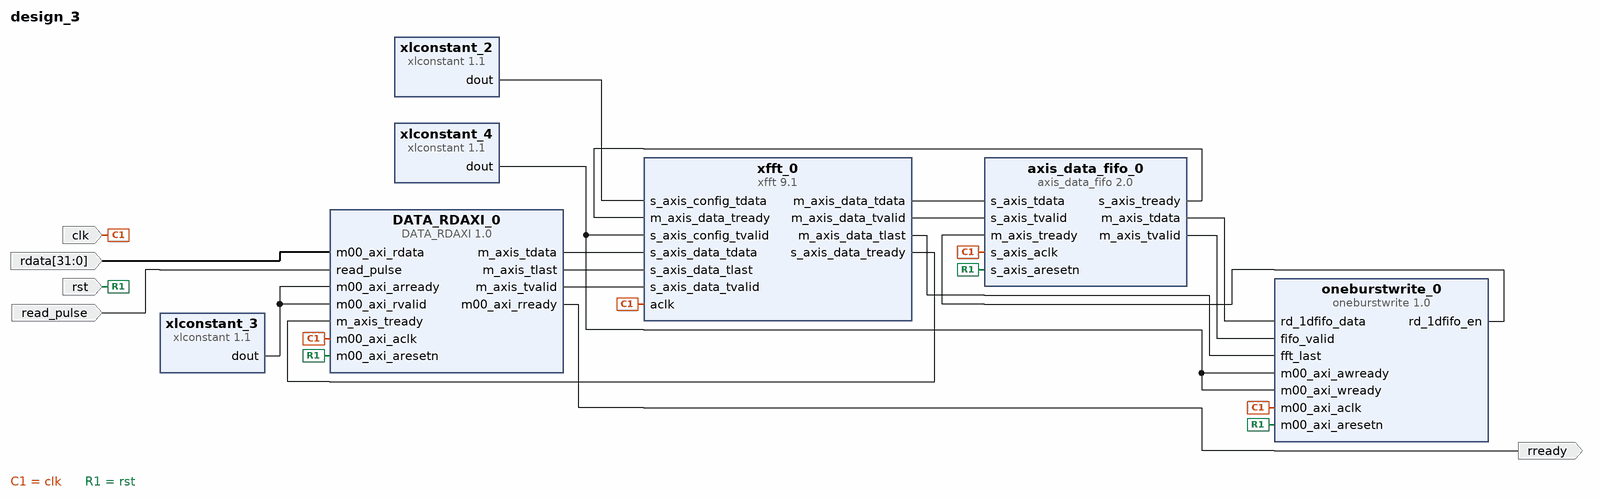
[diagram p0: block diagram of the top level]
# Vivado block design design_3, xczu4ev-sfvc784-1-i, Vivado 2022.1
create_bd_design design_3

create_bd_port -dir I read_pulse
create_bd_port -dir O rready
create_bd_port -dir I -from 31 -to 0 rdata
create_bd_port -dir I -type rst rst
create_bd_port -dir I -type clk clk
set_property -dict {CONFIG.FREQ_HZ 250000000} [get_bd_ports clk]

create_bd_cell -type ip -vlnv xilinx.com:ip:xfft:9.1 xfft_0
set_property -dict [list \
  CONFIG.complex_mult_type use_mults_performance \
  CONFIG.implementation_options radix_4_burst_io \
  CONFIG.memory_options_data block_ram \
  CONFIG.memory_options_hybrid false \
  CONFIG.memory_options_phase_factors block_ram \
  CONFIG.memory_options_reorder block_ram \
  CONFIG.number_of_stages_using_block_ram_for_data_and_phase_factors 0 \
  CONFIG.output_ordering natural_order \
  CONFIG.phase_factor_width 16 \
  CONFIG.rounding_modes convergent_rounding \
  CONFIG.scaling_options unscaled \
  CONFIG.target_clock_frequency 250 \
  CONFIG.throttle_scheme nonrealtime \
  CONFIG.xk_index true \
] [get_bd_cells xfft_0]
create_bd_cell -type ip -vlnv xilinx.com:ip:axis_data_fifo:2.0 axis_data_fifo_0
set_property -dict [list \
  CONFIG.FIFO_DEPTH 32768 \
  CONFIG.FIFO_MEMORY_TYPE block \
  CONFIG.HAS_RD_DATA_COUNT 1 \
  CONFIG.HAS_WR_DATA_COUNT 1 \
  CONFIG.IS_ACLK_ASYNC 0 \
  CONFIG.TDATA_NUM_BYTES 8 \
] [get_bd_cells axis_data_fifo_0]
create_bd_cell -type ip -vlnv xilinx.com:ip:xlconstant:1.1 xlconstant_3
create_bd_cell -type ip -vlnv xilinx.com:ip:xlconstant:1.1 xlconstant_4
create_bd_cell -type ip -vlnv xilinx.com:ip:xlconstant:1.1 xlconstant_2
set_property -dict {CONFIG.CONST_WIDTH 8} [get_bd_cells xlconstant_2]
create_bd_cell -type ip -vlnv xilinx.com:user:DATA_RDAXI:1.0 DATA_RDAXI_0
set_property -dict {CONFIG.C_M00_AXI_BURST_LEN 256} [get_bd_cells DATA_RDAXI_0]
create_bd_cell -type ip -vlnv xilinx.com:user:oneburstwrite:1.0 oneburstwrite_0
set_property -dict [list \
  CONFIG.C_M00_AXI_BURST_LEN 1 \
  CONFIG.C_M00_AXI_DATA_WIDTH 64 \
  CONFIG.C_M00_AXI_TARGET_SLAVE_BASE_ADDR 0x02000000 \
] [get_bd_cells oneburstwrite_0]

# ---- connections ----

connect_bd_net [get_bd_pins DATA_RDAXI_0/m00_axi_rready] [get_bd_ports rready]
connect_bd_net [get_bd_pins DATA_RDAXI_0/m_axis_tdata] [get_bd_pins xfft_0/s_axis_data_tdata]
connect_bd_net [get_bd_pins DATA_RDAXI_0/m_axis_tlast] [get_bd_pins xfft_0/s_axis_data_tlast]
connect_bd_net [get_bd_pins DATA_RDAXI_0/m_axis_tvalid] [get_bd_pins xfft_0/s_axis_data_tvalid]
connect_bd_net [get_bd_pins axis_data_fifo_0/m_axis_tdata] [get_bd_pins oneburstwrite_0/rd_1dfifo_data]
connect_bd_net [get_bd_pins axis_data_fifo_0/m_axis_tvalid] [get_bd_pins oneburstwrite_0/fifo_valid]
connect_bd_net [get_bd_pins axis_data_fifo_0/s_axis_tready] [get_bd_pins xfft_0/m_axis_data_tready]
connect_bd_net -net m00_axi_aclk_0_1 [get_bd_ports clk] \
  [get_bd_pins xfft_0/aclk] [get_bd_pins axis_data_fifo_0/s_axis_aclk] [get_bd_pins DATA_RDAXI_0/m00_axi_aclk] \
  [get_bd_pins oneburstwrite_0/m00_axi_aclk]
connect_bd_net -net m00_axi_aresetn_0_1 [get_bd_ports rst] \
  [get_bd_pins axis_data_fifo_0/s_axis_aresetn] [get_bd_pins DATA_RDAXI_0/m00_axi_aresetn] \
  [get_bd_pins oneburstwrite_0/m00_axi_aresetn]
connect_bd_net -net m00_axi_rdata_0_1 [get_bd_ports rdata] [get_bd_pins DATA_RDAXI_0/m00_axi_rdata]
connect_bd_net [get_bd_pins oneburstwrite_0/rd_1dfifo_en] [get_bd_pins axis_data_fifo_0/m_axis_tready]
connect_bd_net -net read_pulse_0_1 [get_bd_ports read_pulse] [get_bd_pins DATA_RDAXI_0/read_pulse]
connect_bd_net [get_bd_pins xfft_0/m_axis_data_tdata] [get_bd_pins axis_data_fifo_0/s_axis_tdata]
connect_bd_net [get_bd_pins xfft_0/m_axis_data_tlast] [get_bd_pins oneburstwrite_0/fft_last]
connect_bd_net [get_bd_pins xfft_0/m_axis_data_tvalid] [get_bd_pins axis_data_fifo_0/s_axis_tvalid]
connect_bd_net [get_bd_pins xfft_0/s_axis_data_tready] [get_bd_pins DATA_RDAXI_0/m_axis_tready]
connect_bd_net [get_bd_pins xlconstant_2/dout] [get_bd_pins xfft_0/s_axis_config_tdata]
connect_bd_net [get_bd_pins xlconstant_3/dout] [get_bd_pins DATA_RDAXI_0/m00_axi_arready] [get_bd_pins DATA_RDAXI_0/m00_axi_rvalid]
connect_bd_net [get_bd_pins xlconstant_4/dout] \
  [get_bd_pins xfft_0/s_axis_config_tvalid] [get_bd_pins oneburstwrite_0/m00_axi_awready] \
  [get_bd_pins oneburstwrite_0/m00_axi_wready]

validate_bd_design
save_bd_design
